# Altium schematic sheet Schem Lora_f.schdoc
size 289 x 208 mm
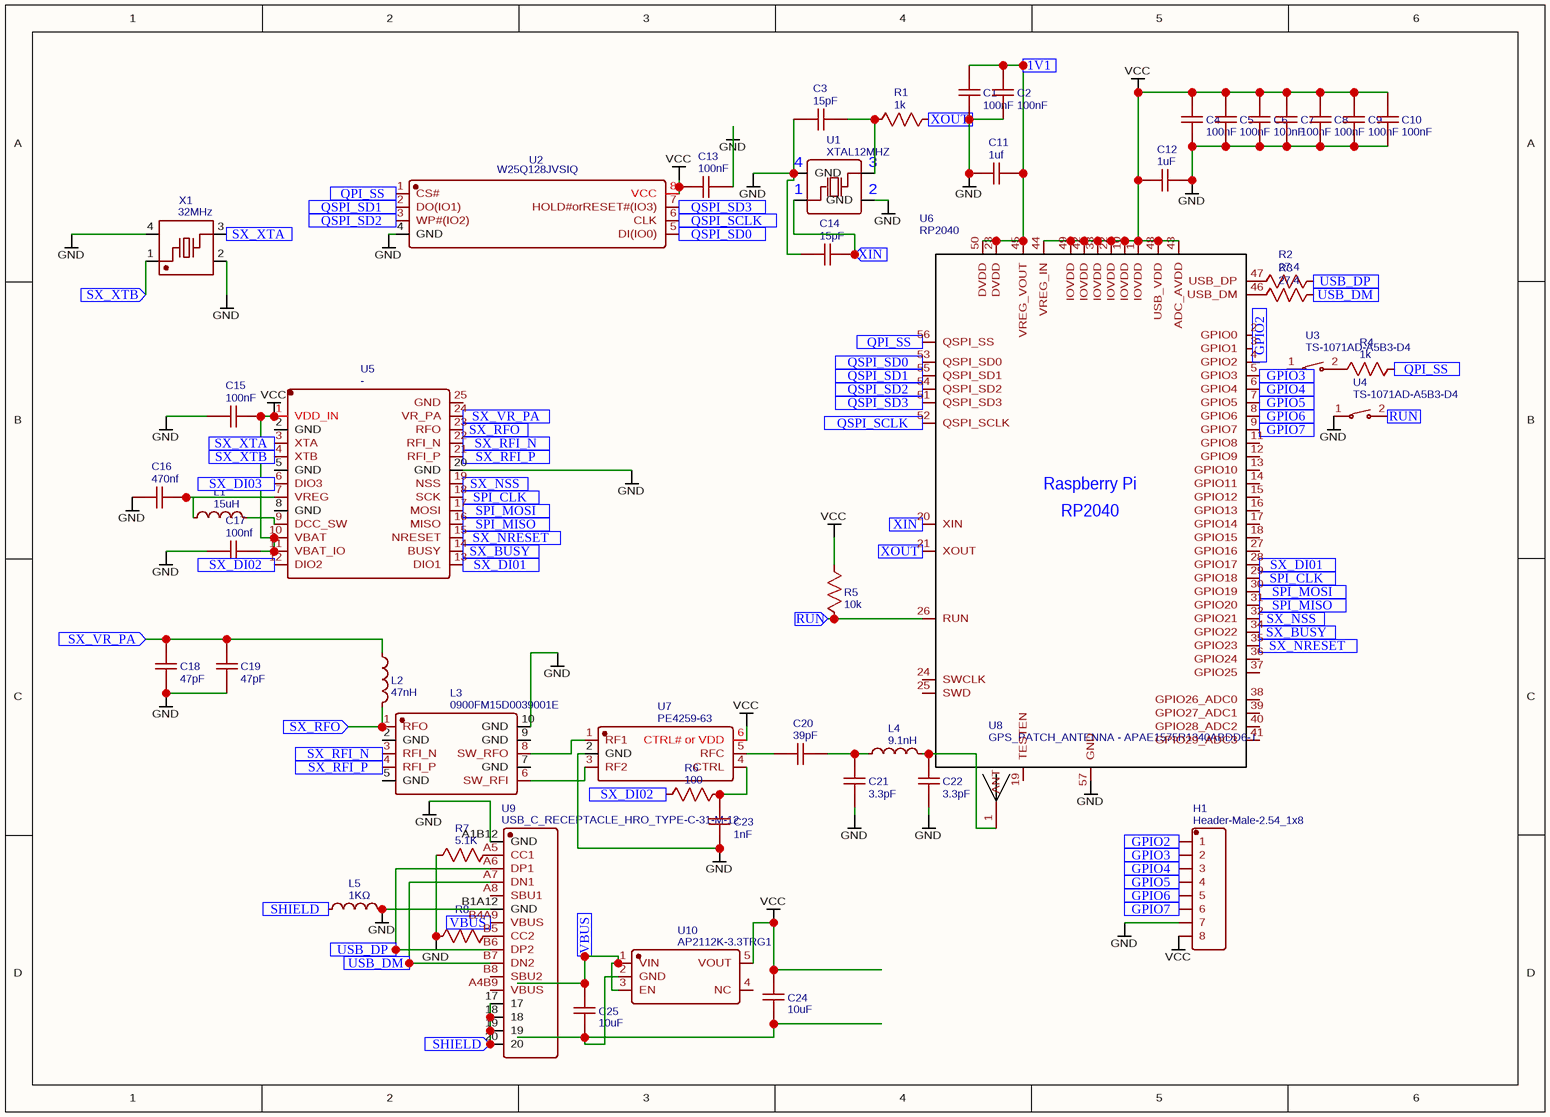
[diagram p0: Schem Lora_f.schdoc]

## Parts
C1  100nF  [C0402]
C2  100nF  [C0402]
C3  15pF  [C0402]
C4  100nF  [C0402]
C5  100nF  [C0402]
C6  100nF  [C0402]
C7  100nF  [C0402]
C8  100nF  [C0402]
C9  100nF  [C0402]
C10  100nF  [C0402]
C11  1uf  [C0402]
C12  1uF  [C0402]
C13  100nF  [C0402]
C14  15pF  [C0402]
C15  100nF  [C0402]
C16  470nf  [C0402]
C17  100nf  [C0402]
C18  47pF  [C0402]
C19  47pF  [C0402]
C20  39pF  [C0402]
C21  3.3pF  [C0402]
C22  3.3pF  [C0402]
C23  1nF  [C0402]
C24  10uF  [C0603]
C25  10uF  [C0603]
H1  Header-Male-2.54_1x8  [HDR-TH_8P-P2.54-V-M]
L1  15uH  [L0402]
L2  47nH  [L0402]
L3  0900FM15D0039001E  [FILTER-SMD_10P-L2.0-W1.3-BL]
L4  9.1nH  [L0402]
L5  1KΩ  [L0402]
R1  1k  [R0402]
R2  27.4  [R0402]
R3  27.4  [R0402]
R4  1k  [R0402]
R5  10k  [R0402]
R6  100  [R0402]
R7  5.1K  [R0402]
R8  5.1K  [R0402]
U1  XTAL12MHZ  [CRYSTAL-SMD_4P-L2.5-W2.0-BL_XTAL12MHZ]
U2  W25Q128JVSIQ  [SOIC-8_L5.3-W5.3-P1.27-LS8.0-BL]
U3  TS-1071AD-A5B3-D4  [KEY-SMD_2P-L4.0-W3.0-P4.20]
U4  TS-1071AD-A5B3-D4  [KEY-SMD_2P-L4.0-W3.0-P4.20]
U5  -  [QFN-24_L4.0-W4.0-P0.50-BL-EP2.6]
U6  RP2040  [LQFN-56_L7.0-W7.0-P0.4-EP]
U7  PE4259-63  [SC-70-6_L2.2-W1.3-P0.65-LS2.1-BL]
U8  GPS_PATCH_ANTENNA - APAE1575R1340ABDD6-T  [GPS_PATCH_ANTENNA - APAE1575R1340ABDD6-T]
U9  USB_C_RECEPTACLE_HRO_TYPE-C-31-M-12  [USB-SMD_TYPE-C16PIN-1]
U10  AP2112K-3.3TRG1  [SOT-25-5_L2.9-W1.6-P0.95-LS2.8-BL]
X1  32MHz  [CRYSTAL-SMD_4P-L2.0-W1.6-BL]

## Ports
1V1 (in), GPIO2 (in), GPIO3 (in), GPIO4 (in), GPIO5 (in), GPIO6 (in), GPIO7 (in), QPI_SS (in), QSPI_SCLK (in), QSPI_SD0 (in), QSPI_SD1 (in), QSPI_SD2 (in), QSPI_SD3 (in), RUN (in), SHIELD (in), SPI_CLK (in), SPI_MISO (in), SPI_MOSI (in), SX_BUSY (in), SX_DI01 (in), SX_DI02 (in), SX_DI03 (in), SX_NRESET (in), SX_NSS (in), SX_RFI_N (in), SX_RFI_P (in), SX_RFO (in), SX_VR_PA (in), SX_XTA (in), SX_XTB (in), USB_DM (in), USB_DP (in), VBUS (in), XIN (in), XOUT (in)

## Nets
GND: C1.1 C2.1 C3.1 C4.1 C5.1 C6.1 C7.1 C8.1 C9.1 C10.1 C11.1 C12.2 C13.2 C14.1 C15.1 C16.1 C17.1 C18.1 C19.1 C21.2 C22.2 C23.1 H1.7 L3.10(GND) L5.2 R1.2 R7.1 R8.1 U1.2(GND) U1.4(GND) U2.4(GND) U3.1(A) U4.1(A) U5.20(GND) U6.21(XOUT) U6.57(GND) U7.2(GND) U9.A1B12(GND) U9.B1A12(GND) X1.2(GND) X1.4(GND) ; port XOUT
VCC: C4.2 C5.2 C6.2 C7.2 C8.2 C9.2 C10.2 C12.1 C13.1 C15.2 C17.2 C24.2 H1.8 R5.2 U2.8(VCC) U5.1(VDD_IN) U5.10(VBAT) U5.11(VBAT_IO) U6.1(IOVDD) U6.10(IOVDD) U6.22(IOVDD) U6.33(IOVDD) U6.42(IOVDD) U6.43(ADC_AVDD) U6.44(VREG_IN) U6.48(USB_VDD) U6.49(IOVDD) U7.6(CTRL#_or_VDD) U10.5(VOUT)
1V1: C1.2 C2.2 C11.2 U6.23(DVDD) U6.45(VREG_VOUT) U6.50(DVDD) ; port 1V1
GPIO2: H1.1 U6.4(GPIO2) ; port GPIO2
GPIO3: H1.2 U6.5(GPIO3) ; port GPIO3
GPIO4: H1.3 U6.6(GPIO4) ; port GPIO4
GPIO5: H1.4 U6.7(GPIO5) ; port GPIO5
GPIO6: H1.5 U6.8(GPIO6) ; port GPIO6
GPIO7: H1.6 U6.9(GPIO7) ; port GPIO7
QPI_SS: R4.2 U2.1(CS#) U6.56(QSPI_SS) ; port QPI_SS
QSPI_SCLK: U2.6(CLK) U6.52(QSPI_SCLK) ; port QSPI_SCLK
QSPI_SD0: U2.5(DI(IO0)) U6.53(QSPI_SD0) ; port QSPI_SD0
QSPI_SD1: U2.2(DO(IO1)) U6.55(QSPI_SD1) ; port QSPI_SD1
QSPI_SD2: U2.3(WP#(IO2)) U6.54(QSPI_SD2) ; port QSPI_SD2
QSPI_SD3: U2.7(HOLD#orRESET#(IO3)) U6.51(QSPI_SD3) ; port QSPI_SD3
RUN: R5.1 U4.2(B) U6.26(RUN) ; port RUN
SHIELD: L5.1 U9.17 U9.18 U9.19 U9.20 ; port SHIELD
SPI_CLK: U5.18(SCK) U6.29(GPIO18) ; port SPI_CLK
SPI_MISO: U5.16(MISO) U6.31(GPIO20) ; port SPI_MISO
SPI_MOSI: U5.17(MOSI) U6.30(GPIO19) ; port SPI_MOSI
SX_BUSY: U5.14(BUSY) U6.34(GPIO22) ; port SX_BUSY
SX_DI01: U5.13(DIO1) U6.28(GPIO17) ; port SX_DI01
SX_DI02: R6.1 U5.12(DIO2) ; port SX_DI02
SX_DI03: U5.6(DIO3) ; port SX_DI03
SX_NRESET: U5.15(NRESET) U6.35(GPIO23) ; port SX_NRESET
SX_NSS: U5.19(NSS) U6.32(GPIO21) ; port SX_NSS
SX_RFI_N: L3.3(RFI_N) U5.22(RFI_N) ; port SX_RFI_N
SX_RFI_P: L3.4(RFI_P) U5.21(RFI_P) ; port SX_RFI_P
SX_RFO: L2.2 L3.1(RFO) U5.23(RFO) ; port SX_RFO
SX_VR_PA: C18.2 C19.2 L2.1 U5.24(VR_PA) ; port SX_VR_PA
SX_XTA: U5.3(XTA) X1.3 ; port SX_XTA
SX_XTB: U5.4(XTB) X1.1 ; port SX_XTB
USB_DM: R3.2 U9.A7(DN1) U9.B7(DN2) ; port USB_DM
USB_DP: R2.2 U9.A6(DP1) U9.B6(DP2) ; port USB_DP
VBUS: C25.2 U9.B4A9(VBUS) U10.1(VIN) U10.3(EN) ; port VBUS
XIN: C14.2 U1.1(OSC1) U6.20(XIN) ; port XIN
NetC3_2: C3.2 R1.1 U1.3(OSC2)
NetC16_2: C16.2 L1.1 U5.7(VREG)
NetC20_1: C20.1 C21.1 L4.1
NetC20_2: C20.2 U7.5(RFC)
NetC22_1: C22.1 L4.2 U8.1(ANT)
NetC23_2: C23.2 R6.2 U7.4(CTRL)
NetC24_1: C24.1 C25.1 U10.2(GND)
NetL1_2: L1.2 U5.9(DCC_SW)
NetL3_6: L3.6(SW_RFI) U7.3(RF2)
NetL3_8: L3.8(SW_RFO) U7.1(RF1)
NetR2_1: R2.1 U6.47(USB_DP)
NetR3_1: R3.1 U6.46(USB_DM)
NetR4_1: R4.1 U3.2(B)
NetR7_2: R7.2 U9.A5(CC1)
NetR8_2: R8.2 U9.B5(CC2)

Not connected (* = marked no-connect by the designer): L3 2(GND) 5(GND) 7(GND) 9(GND); U5 2(GND) 5(GND) 8(GND) 25(GND); U6 2(GPIO0) 3(GPIO1) 11(GPIO8) 12(GPIO9) 13(GPIO10) 14(GPIO11) 15(GPIO12) 16(GPIO13) 17(GPIO14) 18(GPIO15) 19(TESTEN) 24(SWCLK) 25(SWD) 27(GPIO16) 36(GPIO24) 37(GPIO25) 38(GPIO26_ADC0) 39(GPIO27_ADC1) 40(GPIO28_ADC2) 41(GPIO29_ADC3); U9 A4B9(VBUS) A8(SBU1) B8(SBU2); U10 4(NC)

## Notes on the sheet
- (near U1) 4
- (near U1) 1
- (near U1) 3
- (near U1) 2
- (in symbol RP2040) Raspberry Pi

## Library data of the parts
C1 C2 C4-C10 C13 C15 = 100nF: nameAlias: Value(F); Contributor: LCEDA_Lib; spicePre: C; spiceSymbolName: C_0603_US
C3 C14 = 15pF: nameAlias: Value(F); Contributor: LCEDA_Lib; spicePre: C; spiceSymbolName: C_0603_US
C11 = 1uf: nameAlias: Value(F); Contributor: LCEDA_Lib; spicePre: C; spiceSymbolName: C_0603_US
C12 = 1uF: nameAlias: Value(F); Contributor: LCEDA_Lib; spicePre: C; spiceSymbolName: C_0603_US
C16 = 470nf: nameAlias: Value(F); Contributor: LCEDA_Lib; spicePre: C; spiceSymbolName: C_0603_US
C17 = 100nf: nameAlias: Value(F); Contributor: LCEDA_Lib; spicePre: C; spiceSymbolName: C_0603_US
C18 C19 = 47pF: nameAlias: Value(F); Contributor: LCEDA_Lib; spicePre: C; spiceSymbolName: C_0603_US
C20 = 39pF: nameAlias: Value(F); Contributor: LCEDA_Lib; spicePre: C; spiceSymbolName: C_0603_US
C21 C22 = 3.3pF: nameAlias: Value(F); Contributor: LCEDA_Lib; spicePre: C; spiceSymbolName: C_0603_US
C23 = 1nF: nameAlias: Value(F); Contributor: LCEDA_Lib; spicePre: C; spiceSymbolName: C_0603_US
C24 C25 = 10uF: nameAlias: Value(F); Contributor: LCEDA_Lib; spicePre: C; spiceSymbolName: C_0603_US
H1 = Header-Male-2.54_1x8: Manufacturer: Ckmtw(灿科盟); Manufacturer Part: B-2100S08P-A110; Contributor: LCSC; Supplier: LCSC; Supplier Part: C124381; JLCPCB Part Class: Extended Part; spicePre: H; spiceSymbolName: Header-Male-2.54_1x8
L1 = 15uH: nameAlias: Value(H); Contributor: LCEDA_Lib; spicePre: L; spiceSymbolName: L0603_US
L2 = 47nH: nameAlias: Value(H); Contributor: LCEDA_Lib; spicePre: L; spiceSymbolName: L0603_US
L3 = 0900FM15D0039001E: Manufacturer: JOHANSON(约翰逊); Contributor: lcsc; Supplier: LCSC; Supplier Part: C17557877; Manufacturer Part: 0900FM15D0039001E; JLCPCB Part Class: Extended Part; spicePre: L; spiceSymbolName: 0900FM15D0039001E
L4 = 9.1nH: nameAlias: Value(H); Contributor: LCEDA_Lib; spicePre: L; spiceSymbolName: L0603_US
L5 = 1KΩ: Manufacturer: muRata(村田); Manufacturer Part: BLM15AX102SN1D; nameAlias: Value; Supplier: LCSC; Supplier Part: C85815; JLCPCB Part Class: Extended Part; spicePre: L; spiceSymbolName: BLM15AX102SN1D
R1 R4 = 1k: nameAlias: Value(Ω); Contributor: LCEDA_Lib; spicePre: R; spiceSymbolName: R_0603_US
R2 R3 = 27.4: nameAlias: Value(Ω); Contributor: LCEDA_Lib; spicePre: R; spiceSymbolName: R_0603_US
R5 = 10k: nameAlias: Value(Ω); Contributor: LCEDA_Lib; spicePre: R; spiceSymbolName: R_0603_US
R6 = 100: nameAlias: Value(Ω); Contributor: LCEDA_Lib; spicePre: R; spiceSymbolName: R_0603_US
R7 R8 = 5.1K: nameAlias: Value(Ω); Contributor: LCEDA_Lib; spicePre: R; spiceSymbolName: R_0603_US
U1 = XTAL12MHZ: Manufacturer: null; Contributor: LCSC; Supplier: LCSC; Supplier Part: C9900004382; Manufacturer Part: XTAL12MHz; JLCPCB Part Class: Extended Part; spicePre: U; spiceSymbolName: XTAL12MHZ
U2 = W25Q128JVSIQ: Manufacturer: Winbond(华邦); Contributor: LCSC; Supplier: LCSC; Supplier Part: C113767; Manufacturer Part: W25Q128JVSIQ; JLCPCB Part Class: Extended Part; spicePre: U; spiceSymbolName: W25Q128JVSIQ
U3 U4 = TS-1071AD-A5B3-D4: Manufacturer: Yuandi(元迪); Contributor: lcsc; Supplier: LCSC; Supplier Part: C7464637; Manufacturer Part: TS-1071AD-A5B3-D4; JLCPCB Part Class: Extended Part; spicePre: U; spiceSymbolName: TS-1071AD-A5B3-D4
U5 = -: Manufacturer: SEMTECH; Manufacturer Part: SX1262IMLTRT; Contributor: LCSC; nameAlias: Value; Supplier: LCSC; Supplier Part: C191341; JLCPCB Part Class: Extended Part; spicePre: U; spiceSymbolName: SX1262IMLTRT
U6 = RP2040: Manufacturer: Raspberry Pi(树莓派); Contributor: LCSC; Supplier: LCSC; Supplier Part: C2040; Manufacturer Part: RP2040; JLCPCB Part Class: Extended Part; spicePre: U; spiceSymbolName: RP2040
U7 = PE4259-63: Manufacturer: pSemi(游隼半导体); Contributor: LCSC; Supplier: LCSC; Supplier Part: C470892; Manufacturer Part: PE4259-63; JLCPCB Part Class: Extended Part; spicePre: U; spiceSymbolName: PE4259-63
U8 = GPS_PATCH_ANTENNA - APAE1575R1340ABDD6-T: Contributor: Blake Edwards; spicePre: U; spiceSymbolName: GPS_PATCH_ANTENNA - APAE1575R1340ABDD6-T
U9 = USB_C_RECEPTACLE_HRO_TYPE-C-31-M-12: Manufacturer: null; Contributor: lcsc; Supplier: LCSC; Supplier Part: C9900015525; Manufacturer Part: USB_C_Receptacle_HRO_TYPE-C-31-M-12; JLCPCB Part Class: Extended Part; spicePre: U; spiceSymbolName: USB_C_RECEPTACLE_HRO_TYPE-C-31-M-12
U10 = AP2112K-3.3TRG1: Manufacturer: DIODES(美台); Contributor: LCSC; Supplier: LCSC; Manufacturer Part: AP2112K-3.3TRG1; Supplier Part: C51118; JLCPCB Part Class: Extended Part; spicePre: U; spiceSymbolName: AP2112K-3.3TRG1
X1 = 32MHz: Manufacturer: TXC(晶技); Manufacturer Part: 8Y32030001; nameAlias: Value; Contributor: lcsc; Supplier: LCSC; Supplier Part: C5203670; JLCPCB Part Class: Extended Part; spicePre: X; spiceSymbolName: 8Y32030001